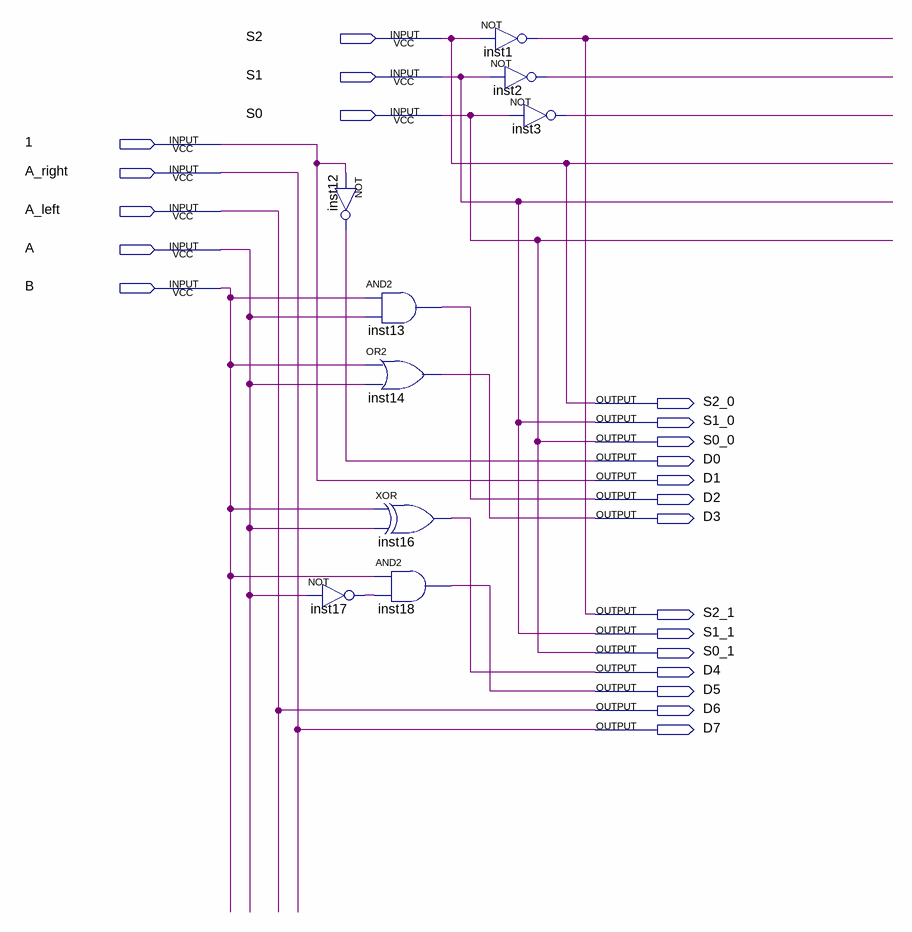
[diagram p0: schematic sheet]
// Quartus schematic OneBitPreMux.bdf as structural Verilog: 9 symbols, 22 pins
module OneBitPreMux (
  input  S2,
  input  S1,
  input  S0,
  input  \1 ,
  input  A_right,
  input  A_left,
  input  A,
  input  B,
  output S2_0,
  output S1_0,
  output S0_0,
  output D0,
  output D1,
  output D2,
  output D3,
  output S2_1,
  output S1_1,
  output S0_1,
  output D4,
  output D5,
  output D6,
  output D7
);

  wire inst2_out, inst3_out, inst17_out;

  not inst12 (D0, \1 );
  not inst17 (inst17_out, A);
  and inst13 (D2, B, A);
  or inst14 (D3, B, A);
  xor inst16 (D4, B, A);
  and inst18 (D5, B, inst17_out);
  not inst1 (S2_1, S2);
  not inst2 (inst2_out, S1);
  not inst3 (inst3_out, S0);

  assign D1 = \1 ;
  assign D6 = A_left;
  assign D7 = A_right;
  assign S0_0 = S0;
  assign S0_1 = S0;
  assign S1_0 = S1;
  assign S1_1 = S1;
  assign S2_0 = S2;
endmodule
